# Altium schematic sheet Tor_330MHz.SchDoc
size A3; Organization: Altium Limited; Address1: L3, 12a Rodborough Rd; Address2: Frenchs Forest; Address3: NSW; Address4: Australia 2086; SheetNumber: 17; SheetTotal: 17
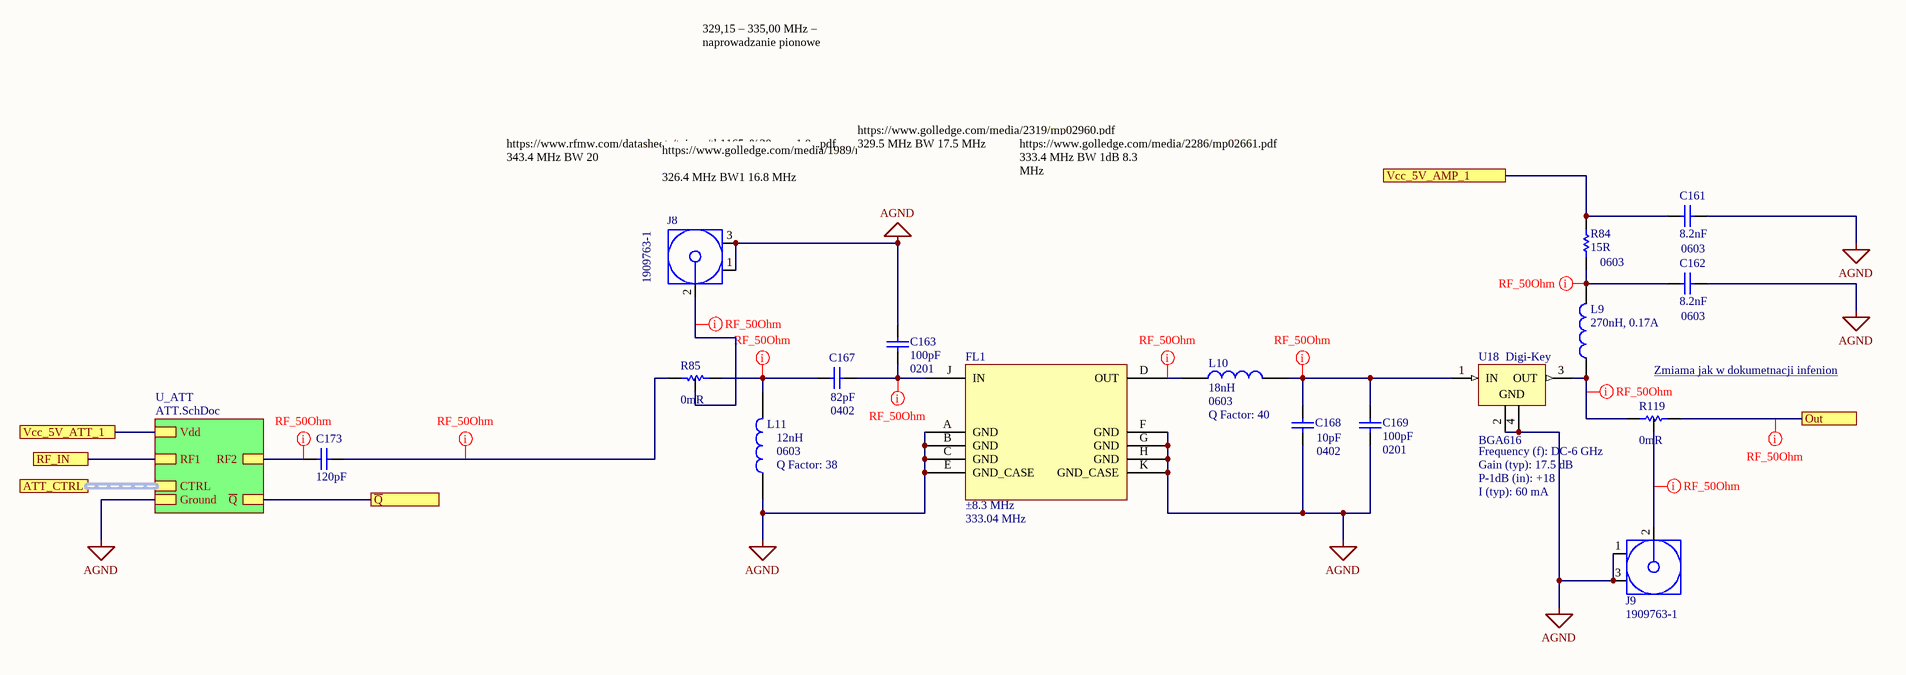
[diagram p0: Tor_330MHz.SchDoc]

## Parts
C161  8.2nF  Case/Package: 0603  [CAP 0603/1608 RF]
C162  8.2nF  Case/Package: 0603  [CAP 0603/1608 RF]
C163  100pF  Case/Package: 0201  [CAP 0201/0603 KK]
C167  82pF  Case/Package: 0402  [CAP 0402/1005 RF KK]
C168  10pF  Case/Package: 0402  [CAP 0402/1005 RF KK]
C169  100pF  Case/Package: 0201  [CAP 0201/0603 KK]
C173  120pF  [CAP 0402/1005 RF KK]
FL1  Bandwidth 1dB: ±8.3 MHz  Center frequency: 333.04 MHz  [TB0787A]  (hidden comment: SAW TB0787A)
J8  1909763-1  [TECO-1909763-1_V]
J9  1909763-1  [TECO-1909763-1_V]
L9  270nH, 0.17A  [WE-KI_0603]
L10  18nH  Case/Package: 0603  Q Factor: 40  [FB0603]
L11  12nH  Case/Package: 0603  Q Factor: 38  [FB0603]
R84  15R  Case/Package: 0603  [RES 0603/1608 RF]
R85  0mR  [RES 0402/1005 RF - 3-PADS]
R119  0mR  [RES 0402/1005 RF - 3-PADS]
U18  BGA616  Frequency (f): DC-6 GHz  Gain (typ): 17.5 dB  I (typ): 60 mA  P-1dB (in): +18  Supplier 2: Digi-Key  [INF-SOT343_V]

## Sub-sheets
U_ATT = ATT.SchDoc: Vdd, Ground, RF1, RF2, CTRL (harness ATT_Controle), ~{Q}

## Ports
ATT_CTRL, Out, RF_IN, Vcc_5V_AMP_1, Vcc_5V_ATT_1, ~{Q}

## Nets
AGND: C161.2 C162.2 C163.1 C168.1 C169.1 FL1.A(GND) FL1.B(GND) FL1.C(GND) FL1.E(GND_CASE) FL1.F(GND) FL1.G(GND) FL1.H(GND) FL1.K(GND_CASE) J8.1 J8.3 J9.1 J9.3 L11.1 U18.2(GND) U18.4(GND) ; sheet U_ATT/Ground
Out: R119.1 ; port Out
~{Q}: port ~{Q}, sheet U_ATT/~{Q}
RF_IN: port RF_IN, sheet U_ATT/RF1
Vcc_5V_AMP_1: C161.1 R84.2 ; port Vcc_5V_AMP_1
Vcc_5V_ATT_1: port Vcc_5V_ATT_1, sheet U_ATT/Vdd
NetC162_1: C162.1 L9.2 R84.1
NetC163_2: C163.2 C167.2 FL1.J(IN)
NetC167_1: C167.1 L11.2 R85.2
NetC168_2: C168.2 C169.2 L10.2 U18.1(IN)
NetC173_1: C173.1 ; sheet U_ATT/RF2
NetC173_2: C173.2 R85.1
NetFL1_D: FL1.D(OUT) L10.1
NetJ8_2: J8.2 R85.3
NetJ9_2: J9.2 R119.3
NetL9_1: L9.1 R119.2 U18.3(OUT)

## Buses and harness runs
harness port ATT_CTRL = sheet U_ATT/CTRL

## Layout directives
net class Single50: NetC162_1, NetC163_2, NetC167_1, NetC168_2, NetC173_1, NetC173_2, NetFL1_D, NetJ8_2, NetJ9_2, NetL9_1, Out

## Notes on the sheet
- 329,15 – 335,00 MHz – naprowadzanie pionowe
- https://www.golledge.com/media/2319/mp02960.pdf
  329.5 MHz BW 17.5 MHz
- https://www.rfmw.com/datasheets/taisaw/tb1165a%20_rev.1.0_.pdf
  343.4 MHz BW 20
- (near J8) https://www.golledge.com/media/1989/ma08024.pdf
  326.4 MHz BW1 16.8 MHz
- https://www.golledge.com/media/2286/mp02661.pdf
  333.4 MHz BW 1dB 8.3 MHz
- (near R119) Zmiama jak w dokumetnacji infenion <https://www.infineon.com/dgdl/AN098.pdf?fileId=db3a30431441fb5d0114b6641c751744>
- Title
- Size:
- Date:
- A3
- Number:
- Time:
- Revision:
- Sheet
- of
- File:

## Library data of the parts
C161 C162 = Capacitor: Multilayer Ceramic Capacitors MLCC - SMD/SMT 0603 8,200pF 50volts C0G +/-5%; Manufacturer: Murata; Manufacturer Part Number: GRM1885C1H822JA01D; Voltage Rating: 50V; Tolerance: 5%; Supplier 1: Digi-Key; Supplier Part Number 1: 490-11482-1-ND; RoHS: Yes; Category: Ceramic Capacitors; Stock 1: 65615; Pricing 1: 1=0,21000, 10=0,14200, 50=0,08500, 100=0,07170, 500=0,04908, 1000=0,04341 (USD); Mount: Surface Mount; Case Code (Imperial): 0603; Case Code (Metric): 1608; Min Operating Temperature: -55°C; Max Operating Temperature: 125°C; Dielectric: C0G; Capacitance: 8.2nF; Voltage Rating (DC): 50V; Packaging: Tape and Reel; Package Quantity: 4000; Termination: SMD/SMT; Length: 0.063inch; Height: 0.8mm; Width: 0.031inch; Thickness: 0.035inch; ComponentLink1URL: https://datasheet.ciiva.com/29537/partnumbering-e-01-29537913.pdf?src-supplier=Digi-Key; ComponentLink1Description: https://datasheet.ciiva.com/29537/partnumbering-e-01-29537913.pdf?src-supplier=Digi-Key
C163 C169 = Capacitor: Multilayer Ceramic Capacitors MLCC - SMD/SMT 0201 100pF 25volts C0G +/-5%; Manufacturer: Murata; Manufacturer Part Number: GRM0335C1E101JA01D; Tolerance: 5%; Voltage: 25V; Supplier 1: Digi-Key; Supplier Part Number 1: 490-3160-1-ND; RoHS: Yes; Category: Ceramic Capacitors; Stock 1: 270262; Pricing 1: 1=0,10000, 10=0,01300, 100=0,00560, 500=0,00400, 1000=0,00315, 2500=0,00286, 5000=0,00263 (USD); Mount: Surface Mount; Case Code (Metric): 0603; Case Code (Imperial): 0201; Min Operating Temperature: -55°C; Max Operating Temperature: 125°C; Dielectric: C0G; Capacitance: 100pF; Termination: SMD/SMT; Package Quantity: 15000; Packaging: Tape and Reel; Voltage Rating: 25V; Voltage Rating (DC): 25V; Length: 0.6mm; Height: 0.3mm; Thickness: 0.013inch; Depth: 0.3mm; Width: 0.012inch; Radiation Hardening: No; REACH SVHC: No SVHC; Lead Free: Lead Free; ComponentLink1URL: https://datasheet.ciiva.com/16497/grm0335c1e101ja01-01-16497112.pdf?src-supplier=Future+Electronics; ComponentLink1Description: https://datasheet.ciiva.com/16497/grm0335c1e101ja01-01-16497112.pdf?src-supplier=Future+Electronics; ComponentLink2URL: https://datasheet.ciiva.com/18697/product-18697797.pdf?src-supplier=Digi-Key; ComponentLink2Description: https://datasheet.ciiva.com/18697/product-18697797.pdf?src-supplier=Digi-Key
C167 = Capacitor: CERAMIC CAPACITOR, 82PF, 25V, C0G/NP0, 0402; Product Range:VJ HIFREQ Series; Capacitance:82pF; Capacitance Tolerance: 5%; Dielectric Characteristic:C0G / NP0; Voltage Rating:25V; Ceramic Capacitor Case:0402 [1005 Metric] ;RoHS Compliant: Yes; Manufacturer: Vishay Vitramon; Manufacturer Part Number: VJ0402D820JXXAJ; Dielectric: C0G; Temperature Coefficient: 30ppm/°C; Supplier 1: Digi-Key; Supplier Part Number 1: 720-1297-1-ND; RoHS: Yes; Category: Ceramic Capacitors; Stock 1: 90328; Pricing 1: 1=0,52000, 10=0,36500, 50=0,27620, 100=0,24060, 500=0,17820 (USD); Mount: Surface Mount,PCB; Weight: 2.3E-05oz; Case Code (Imperial): 0402; Case Code (Metric): 1005; Min Operating Temperature: -55°C; Max Operating Temperature: 125°C; Packaging: Tape and Reel; Package Quantity: 1; Termination: SMD/SMT; Capacitance: 82pF; Tolerance: 5%; Voltage Rating: 25V; Voltage Rating (DC): 25V; Voltage: 25V; Length: 1.02mm; Height: 0.61mm; Width: 0.51mm; Thickness: 0.024inch; Depth: 0.51mm; Radiation Hardening: No; REACH SVHC: Unknown; Lead Free: Lead Free; ComponentLink1URL: https://datasheet.ciiva.com/30503/0900766b812428e7-30503890.pdf?src-supplier=RSComponents; ComponentLink1Description: https://datasheet.ciiva.com/30503/0900766b812428e7-30503890.pdf?src-supplier=RSComponents; ComponentLink2URL: https://datasheet.ciiva.com/16511/vj0402dseries-16511415.pdf?src-supplier=Future+Electronics; ComponentLink2Description: https://datasheet.ciiva.com/16511/vj0402dseries-16511415.pdf?src-supplier=Future+Electronics; ComponentLink3URL: https://datasheet.ciiva.com/6286/vjhifreq-6286552.pdf?src-supplier=Digi-Key; ComponentLink3Description: https://datasheet.ciiva.com/6286/vjhifreq-6286552.pdf?src-supplier=Digi-Key; ComponentLink4URL: https://datasheet.ciiva.com/7974/1631376-7974937.pdf?src-supplier=Element14; ComponentLink4Description: https://datasheet.ciiva.com/7974/1631376-7974937.pdf?src-supplier=Element14; ComponentLink5URL: https://datasheet.ciiva.com/6286/vjhifreq-6286555.pdf?src-supplier=Digi-Key; ComponentLink5Description: https://datasheet.ciiva.com/6286/vjhifreq-6286555.pdf?src-supplier=Digi-Key; ComponentLink6URL: https://datasheet.ciiva.com/49031/70396551-49031980.pdf?src-supplier=Allied+Electronics; ComponentLink6Description: https://datasheet.ciiva.com/49031/70396551-49031980.pdf?src-supplier=Allied+Electronics; ComponentLink7URL: https://datasheet.ciiva.com/6286/vjhifreq-6286558.pdf?src-supplier=Digi-Key; ComponentLink7Description: https://datasheet.ciiva.com/6286/vjhifreq-6286558.pdf?src-supplier=Digi-Key
C168 = Capacitor: KEMET - CBR04C100F5GAC - Capacitor, RF, 10 pF, 50 V, HiQ-CBR Series, ± 1%, 125 °C, 0402 [1005 Metric]; Voltage Rating: 50V; Dielectric: C0G; Supplier 1: Digi-Key; Supplier Part Number 1: 399-8805-1-ND; Manufacturer: KEMET; Manufacturer Part Number: CBR04C100F5GAC; RoHS: Yes; Category: Ceramic Capacitors; Stock 1: 134697; Pricing 1: 1=0,23000, 10=0,15500, 50=0,09300, 100=0,07860, 500=0,05376, 1000=0,04756, 2500=0,04550, 5000=0,04136 (USD); Mount: Surface Mount; Case Code (Metric): 1005; Case Code (Imperial): 0402; Min Operating Temperature: -55°C; Max Operating Temperature: 125°C; Package Quantity: 10000; Capacitance: 10pF; Tolerance: 1%; Packaging: Cut Tape; Voltage Rating (DC): 50V; Length: 0.039inch; Width: 0.02inch; Thickness: 0.022inch; REACH SVHC: No SVHC; ComponentLink1URL: https://datasheet.ciiva.com/6276/kem-c1030-cbr-smd-6276869.pdf?src-supplier=Digi-Key; ComponentLink1Description: https://datasheet.ciiva.com/6276/kem-c1030-cbr-smd-6276869.pdf?src-supplier=Digi-Key; ComponentLink2URL: https://datasheet.ciiva.com/6276/kem-c1030-cbr-smd-6276872.pdf?src-supplier=Digi-Key; ComponentLink2Description: https://datasheet.ciiva.com/6276/kem-c1030-cbr-smd-6276872.pdf?src-supplier=Digi-Key; ComponentLink3URL: https://datasheet.ciiva.com/6276/kem-c1030-cbr-smd-6276875.pdf?src-supplier=Digi-Key; ComponentLink3Description: https://datasheet.ciiva.com/6276/kem-c1030-cbr-smd-6276875.pdf?src-supplier=Digi-Key
C173 = Capacitor: CAP CER 120PF 25V C0G/NP0 0402; Manufacturer: KEMET; Manufacturer Part Number: C0402C121J3GAC7867; Tolerance: 5%; Supplier 1: Digi-Key; Supplier Part Number 1: 399-14880-1-ND; RoHS: No; Category: Ceramic Capacitors; Stock 1: 43311; Pricing 1: 1=0,10000, 10=0,04100, 50=0,02260, 100=0,01840, 500=0,01312, 1000=0,01032, 2500=0,00938, 5000=0,00863 (USD); Mount: Surface Mount; Case/Package: 0402; Case Code (Imperial): 0402; Case Code (Metric): 1005; Min Operating Temperature: -55°C; Max Operating Temperature: 125°C; Packaging: Tape and Reel; Capacitance: 120pF; Voltage Rating: 25V; ComponentLink1URL: https://api.kemet.com/component-edge/download/datasheet/C0402C121J3GAC7867.pdf?src-supplier=Digi-Key; ComponentLink1Description: https://api.kemet.com/component-edge/download/datasheet/C0402C121J3GAC7867.pdf?src-supplier=Digi-Key
FL1 = SAW TB0787A: SAW Filter 333.04MHz / Model: TB0787A / Part No: MP02661; Source Power: 10 dBm; ComponentLink1Description: Datasheet; ComponentLink1URL: https://www.golledge.com/media/2286/mp02661.pdf
J8 J9 = 1909763-1: Ultra Miniature Coaxial Connector Jack, 60 V, 50 Ohm, -40 to 90 degC, RoHS, Tape and Reel; Brand: TE Connectivity / AMP; Maximum Frequency: 6 GHz; Gender: Jack (Female); Body Material: Liquid Crystal Polymer (LCP); RF Series: UMCC; Impedance: 50 Ohms; DatasheetVersion: Rev. B2; PackageReference: SMD; PackageDescription: 3-Pin Surface Mount Device, Body 2.6 x 2.6 mm; Supplier 1: Newark; Supplier Part Number 1: 62X0488; Supplier 2: Farnell; Supplier Part Number 2: 2781689; Supplier 3: Digi-Key; Supplier Part Number 3: A118077TR-ND; Supplier 4: Digi-Key; Supplier Part Number 4: A118077CT-ND; Supplier 5: Digi-Key; Supplier Part Number 5: A118077DKR-ND; Product Category: RF Connectors / Coaxial Connectors; Packaging: Reel; Product: Connectors; Orientation: Straight; Operating Temperature Range: - 40 C to + 90 C; Factory Pack Quantity: 5000; RoHS: Details; Contact Plating: Gold; Contact Material: Copper Alloy; Mounting Technology: Surface Mount; ComponentLink1Description: Manufacturer URL; ComponentLink1URL: http://www.te.com; ComponentLink2Description: Datasheet; ComponentLink2URL: http://www.te.com/commerce/DocumentDelivery/DDEController?Action=srchrtrv&DocNm=1909763&DocType=Customer+Drawing&DocLang=English
L9 = 744761227A: Wurth WE-KI Series Shielded Wire-wound SMD Inductor with a Ceramic Core, 270 nH 170mA Idc Q:30; Manufacturer: Wurth Elektronik; Q-Factor min.: 30; Inductance Tolerance: +/-5%; DC Resistance max.: 1.8Ohm; Self Resonant Frequency: 1000MHz; ComponentLink1Description: Manufacturer; ComponentLink1URL: http://www.we-online.de; ComponentLink2Description: Datasheet; ComponentLink2URL: https://www.we-online.com/catalog/datasheet/744761227A.pdf; Published Date: April 2020; Rated Current: 0.17A; Packaging: Tape and Reel; Operating Temperature: -40 to +125degC; Manufacturer Part Number: 744761227A; Size: 0603; Inductance: 270nH; Mounting Technology: SMT; Supplier 1: Digi-Key; Supplier Part Number 1: 732-744761227ACT-ND; RoHS: No; Category: Fixed Inductors; Stock 1: 2580; Pricing 1: 1=0,28000, 10=0,24700, 100=0,22800, 500=0,20900, 1000=0,19300 (USD)
L10 = Inductor: Inductor RF Chip Wirewound 18nH 2% 100MHz 40Q-Factor 550mA 160mOhm DCR 0603 T/R; Manufacturer: Murata; Manufacturer Part Number: LQW18AN18NG00D; Self Resonant Frequency: 5.5GHz; Shielding: Unshielded; Current: 420mA; DC Resistance (DCR): 160mR; Supplier 1: Digi-Key; Supplier Part Number 1: 490-6870-1-ND; RoHS: Yes; Category: Fixed Inductors; Stock 1: 44079; Pricing 1: 1=0,17000, 10=0,15700, 25=0,14000, 50=0,11900, 100=0,10490, 250=0,09620, 500=0,08746, 1000=0,07346 (USD); Mount: Surface Mount; Weight: 0.000106oz; Case Code (Imperial): 0603; Case Code (Metric): 1608; Min Operating Temperature: -55°C; Max Operating Temperature: 125°C; Tolerance: 2%; Inductance Tolerance: 2%; Packaging: Tape and Reel; Inductance: 18nH; Package Quantity: 4000; Max DC Current: 550mA; Current Rating: 550mA; Termination: SMD/SMT; Test Frequency: 100MHz; Composition: Wirewound; DC Current: 550mA; Military Standard: Not; Series Resistance: 160mR; Length: 1.6mm; Height: 0.8mm; Width: 0.8mm; Depth: 1mm; Radiation Hardening: No; Lead Free: Lead Free; REACH SVHC: No SVHC; ComponentLink1URL: https://datasheet.ciiva.com/11801/0900766b80a002db-11801456.pdf?src-supplier=RSComponents; ComponentLink1Description: https://datasheet.ciiva.com/11801/0900766b80a002db-11801456.pdf?src-supplier=RSComponents; ComponentLink2URL: https://datasheet.ciiva.com/14124/qhlqw18a-data-e-14124618.pdf?src-supplier=Distrelec; ComponentLink2Description: https://datasheet.ciiva.com/14124/qhlqw18a-data-e-14124618.pdf?src-supplier=Distrelec; ComponentLink3URL: https://datasheet.ciiva.com/16216/l0075s0080lqw18a-00-16216442.pdf?src-supplier=Future+Electronics; ComponentLink3Description: https://datasheet.ciiva.com/16216/l0075s0080lqw18a-00-16216442.pdf?src-supplier=Future+Electronics; ComponentLink4URL: https://datasheet.ciiva.com/6709/l0075s0080lqw18a-00-6709815.pdf?src-supplier=Digi-Key; ComponentLink4Description: https://datasheet.ciiva.com/6709/l0075s0080lqw18a-00-6709815.pdf?src-supplier=Digi-Key; ComponentLink5URL: https://datasheet.ciiva.com/6709/l0075s0080lqw18a-00-6709816.pdf?src-supplier=Digi-Key; ComponentLink5Description: https://datasheet.ciiva.com/6709/l0075s0080lqw18a-00-6709816.pdf?src-supplier=Digi-Key; ComponentLink6URL: https://datasheet.ciiva.com/17278/l0075s0080lqw18a-00-17278376.pdf?src-supplier=Avnet+Europe; ComponentLink6Description: https://datasheet.ciiva.com/17278/l0075s0080lqw18a-00-17278376.pdf?src-supplier=Avnet+Europe; ComponentLink7URL: https://datasheet.ciiva.com/6709/l0075s0080lqw18a-00-6709818.pdf?src-supplier=Digi-Key; ComponentLink7Description: https://datasheet.ciiva.com/6709/l0075s0080lqw18a-00-6709818.pdf?src-supplier=Digi-Key
L11 = Inductor: FIXED IND 12NH 750MA 71 MOHM SMD; Manufacturer: Murata; Manufacturer Part Number: LQW18AN12NJ10D; Core Material: Non-Magnetic; Current: 550mA; DC Resistance (DCR): 71mR; Test Frequency: 100MHz; Tolerance: 5%; Shielding: Unshielded; Self Resonant Frequency: 5GHz; Supplier 1: Digi-Key; Supplier Part Number 1: 490-6863-1-ND; RoHS: Yes; Category: Fixed Inductors; Stock 1: 1061; Pricing 1: 1=0,17000, 10=0,15700, 25=0,14000, 50=0,11900, 100=0,10490, 250=0,09620, 500=0,08746, 1000=0,07346 (USD); Mount: Surface Mount; Weight: 0.000106oz; Case Code (Imperial): 0603; Case Code (Metric): 1608; Min Operating Temperature: -55°C; Max Operating Temperature: 125°C; Inductance: 12nH; Max DC Current: 750mA; Termination: SMD/SMT; Composition: Wirewound; DC Current: 750mA; Military Standard: Not; Packaging: Tape and Reel; Package Quantity: 4000; Current Rating: 750mA; Length: 1.6mm; Height: 0.8mm; Height - Seated (Max): 0.039inch; Depth: 1.1mm; Width: 0.8mm; Radiation Hardening: No; Lead Free: Lead Free; ComponentLink1URL: https://datasheet.ciiva.com/16390/lqw18an12nj10d-16390352.pdf?src-supplier=Future+Electronics; ComponentLink1Description: https://datasheet.ciiva.com/16390/lqw18an12nj10d-16390352.pdf?src-supplier=Future+Electronics; ComponentLink2URL: https://datasheet.ciiva.com/11801/0900766b80a002db-11801464.pdf?src-supplier=RSComponents; ComponentLink2Description: https://datasheet.ciiva.com/11801/0900766b80a002db-11801464.pdf?src-supplier=RSComponents; ComponentLink3URL: https://datasheet.ciiva.com/6705/l0075s0080lqw18a-10-6705450.pdf?src-supplier=Digi-Key; ComponentLink3Description: https://datasheet.ciiva.com/6705/l0075s0080lqw18a-10-6705450.pdf?src-supplier=Digi-Key; ComponentLink4URL: https://datasheet.ciiva.com/6705/l0075s0080lqw18a-10-6705453.pdf?src-supplier=Digi-Key; ComponentLink4Description: https://datasheet.ciiva.com/6705/l0075s0080lqw18a-10-6705453.pdf?src-supplier=Digi-Key; ComponentLink5URL: https://datasheet.ciiva.com/6705/l0075s0080lqw18a-10-6705454.pdf?src-supplier=Digi-Key; ComponentLink5Description: https://datasheet.ciiva.com/6705/l0075s0080lqw18a-10-6705454.pdf?src-supplier=Digi-Key
R84 = Resistor: RES SMD 15 OHM 0.5% 1/16W 0603; Manufacturer: Susumu; Manufacturer Part Number: RR0816Q-150-D; Power Rating: 63mW; Voltage Rating: 75V; Temperature Coefficient: 50ppm/°C; Supplier 1: Digi-Key; Supplier Part Number 1: RR08Q15DCT-ND; RoHS: Yes; Category: Chip SMD Resistors; Stock 1: 15480; Pricing 1: 1=0,10000, 10=0,09300, 100=0,03580, 1000=0,01575, 2500=0,01360 (USD); Number of Pins: 2; Case Code (Imperial): 0603; Case Code (Metric): 1608; Min Operating Temperature: -55°C; Max Operating Temperature: 125°C; Resistance: 15R; Packaging: Tape and Reel; Tolerance: 0.5%; Package Quantity: 1; Termination: SMD/SMT; Resistor Type: Thin Film; Number of Terminations: 2; Max Power Dissipation: 63mW; Voltage Rating (DC): 75V; Length: 1.6mm; Height: 0.4mm; Width: 0.8mm; Depth: 0.8mm; REACH SVHC: Unknown; Lead Free: Lead Free; ComponentLink1URL: https://datasheet.ciiva.com/11820/0900766b80808d64-11820652.pdf?src-supplier=RSComponents; ComponentLink1Description: https://datasheet.ciiva.com/11820/0900766b80808d64-11820652.pdf?src-supplier=RSComponents; ComponentLink2URL: https://datasheet.ciiva.com/2497/rr-data-sheet-2497981.pdf?src-supplier=Digi-Key; ComponentLink2Description: https://datasheet.ciiva.com/2497/rr-data-sheet-2497981.pdf?src-supplier=Digi-Key; ComponentLink3URL: https://datasheet.ciiva.com/2497/rr-data-sheet-2497982.pdf?src-supplier=Digi-Key; ComponentLink3Description: https://datasheet.ciiva.com/2497/rr-data-sheet-2497982.pdf?src-supplier=Digi-Key; ComponentLink4URL: https://datasheet.ciiva.com/2497/rr-data-sheet-2497983.pdf?src-supplier=Digi-Key; ComponentLink4Description: https://datasheet.ciiva.com/2497/rr-data-sheet-2497983.pdf?src-supplier=Digi-Key
R85 R119 = Resistor: YAGEO - RC0402JR-070RL. - RES, THICK FILM, 0R, 0.0625W, 0402; Power Rating: 62.5mW; Tolerance: 5%; Max Power Dissipation: 63mW; Temperature Coefficient: 200ppm/°C; Voltage Rating: 50V; Supplier 1: Digi-Key; Supplier Part Number 1: 311-0.0JRDKR-ND; Manufacturer: Yageo; Manufacturer Part Number: RC0402JR-070RL; RoHS: Yes; Category: Chip SMD Resistors; Stock 1: 19267045; Pricing 1: 1=0,10000, 10=0,01300, 25=0,00920, 50=0,00720, 100=0,00530, 250=0,00400, 500=0,00320, 1000=0,00236, 5000=0,00169 (USD); Case/Package: 0402; Contact Plating: Tin,Matte; Case Code (Metric): 1005; Case Code (Imperial): 0402; Min Operating Temperature: -55°C; Max Operating Temperature: 155°C; Resistance: 0mR; Packaging: Tape and Reel; Composition: Thick Film; Package Quantity: 1; Number of Terminations: 2; Termination: SMD/SMT; Military Standard: Not; Features: Moisture Resistant; Length: 1mm; Height: 0.016inch; Width: 0.02inch; Depth: 0.5mm; Radiation Hardening: No; Lead Free: Lead Free; REACH SVHC: Unknown; ComponentLink1URL: https://datasheet.ciiva.com/2452/pyu-rc0402-51-rohs-l-6-2452608.pdf?src-supplier=Digi-Key; ComponentLink1Description: https://datasheet.ciiva.com/2452/pyu-rc0402-51-rohs-l-6-2452608.pdf?src-supplier=Digi-Key; ComponentLink2URL: https://datasheet.ciiva.com/11808/0900766b80c66297-11808195.pdf?src-supplier=RSComponents; ComponentLink2Description: https://datasheet.ciiva.com/11808/0900766b80c66297-11808195.pdf?src-supplier=RSComponents; ComponentLink3URL: https://datasheet.ciiva.com/2452/pyu-r-int-thick-7-2452609.pdf?src-supplier=Digi-Key; ComponentLink3Description: https://datasheet.ciiva.com/2452/pyu-r-int-thick-7-2452609.pdf?src-supplier=Digi-Key; ComponentLink4URL: https://datasheet.ciiva.com/2452/pyu-r-int-thick-7-2452610.pdf?src-supplier=Digi-Key; ComponentLink4Description: https://datasheet.ciiva.com/2452/pyu-r-int-thick-7-2452610.pdf?src-supplier=Digi-Key; ComponentLink5URL: https://datasheet.ciiva.com/8896/pyu-rc0402-51-rohs-l-6-8896201.pdf?src-supplier=Avnet; ComponentLink5Description: https://datasheet.ciiva.com/8896/pyu-rc0402-51-rohs-l-6-8896201.pdf?src-supplier=Avnet; ComponentLink6URL: https://datasheet.ciiva.com/28386/pyu-rc0402-51-rohs-l-6-28386633.pdf?src-supplier=Avnet+Europe; ComponentLink6Description: https://datasheet.ciiva.com/28386/pyu-rc0402-51-rohs-l-6-28386633.pdf?src-supplier=Avnet+Europe; ComponentLink7URL: https://datasheet.ciiva.com/22747/1018594-22747515.pdf?src-supplier=Element14; ComponentLink7Description: https://datasheet.ciiva.com/22747/1018594-22747515.pdf?src-supplier=Element14; ComponentLink8URL: https://datasheet.ciiva.com/15189/getdatasheetpartid-326379-15189533.pdf?src-supplier=Verical; ComponentLink8Description: https://datasheet.ciiva.com/15189/getdatasheetpartid-326379-15189533.pdf?src-supplier=Verical; ComponentLink9URL: https://datasheet.ciiva.com/7983/1018594-7983535.pdf?src-supplier=Element14; ComponentLink9Description: https://datasheet.ciiva.com/7983/1018594-7983535.pdf?src-supplier=Element14
U18 = BGA616: Silicon Germanium Broadband MMIC Amplifier, DC-6 GHz, 17.5 dB Gain, SOT343, Green; Manufacturer: Infineon; F (typ): 2.9 dB; Green: yes; DatasheetVersion: Rev. 2.1; PackageReference: SOT343; PackageDescription: 4-Pin Small Outline Transistor Package, 1.25 x 2 mm Body; Supplier 1: Mouser; Supplier Part Number 1: N/A; Halogen-free: yes; Mounting Technology: Surface Mount; PartNumber: BGA616; ComponentLink1Description: Manufacturer URL; ComponentLink1URL: http://www.infineon.com/; ComponentLink2Description: Datasheet; ComponentLink2URL: http://www.infineon.com/dgdl/BGA616.pdf?folderId=db3a30431441fb5d0114b654e6581730&fileId=db3a304314dca3890115419102bb163b&location=en.Products.RF.RF_MMIC.CATV___Broadband_Amplifier.DATASHEET.BGA616.pdf; ComponentLink3Description: Package Specification; ComponentLink3URL: http://www.infineon.com/dgdl/SOT343-Package_Overview.pdf?folderId=db3a30431936bc4b0119535155343cba&fileId=db3a30431936bc4b0119535a9f393cd3; Supplier Part Number 2: BGA616H6327XTSA1CT-ND